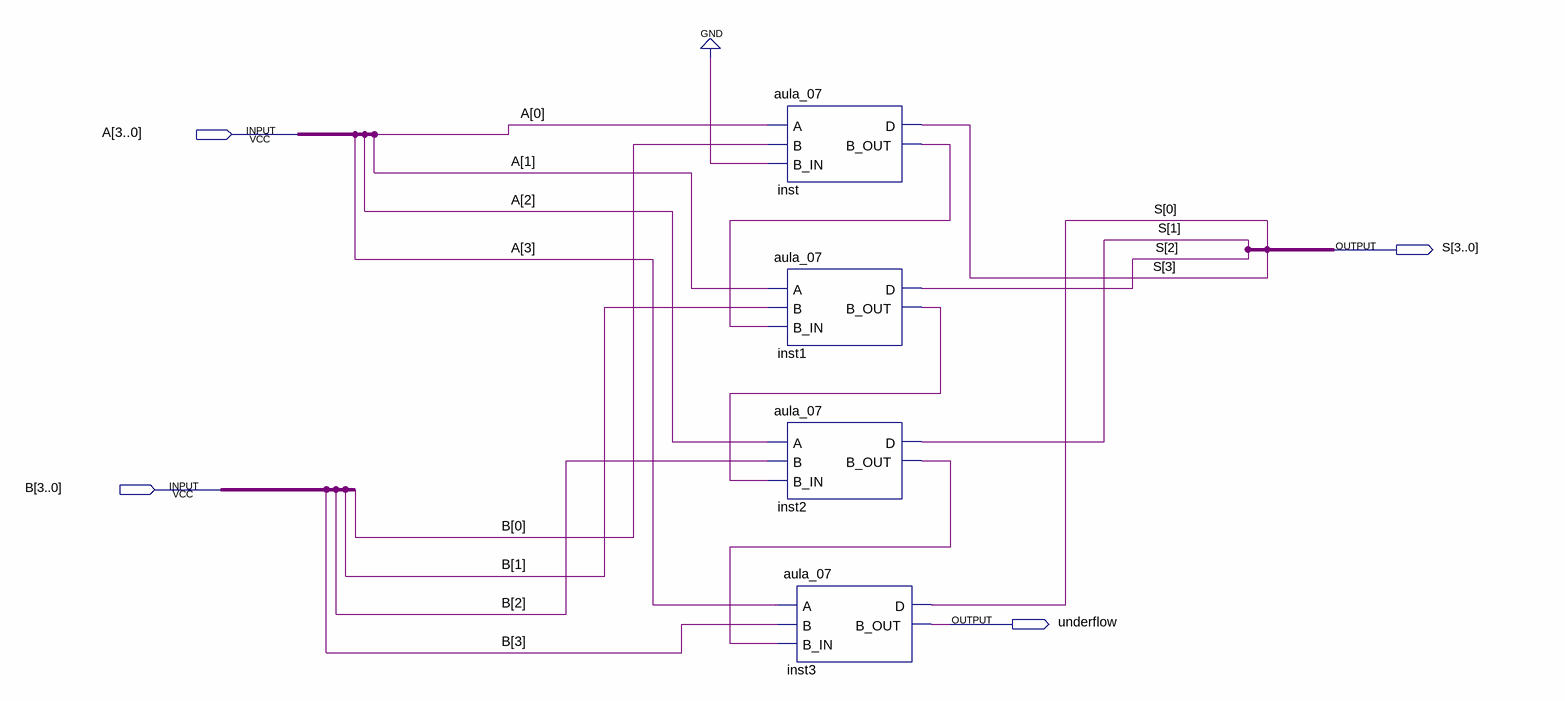
[diagram p0: schematic sheet]
// Quartus schematic aula_08.bdf as structural Verilog: 4 symbols, 4 pins
module aula_08 (
  input  [3:0] A,
  input  [3:0] B,
  output [3:0] S,
  output underflow
);

  wire inst1_b_out, inst2_b_out, inst_b_out;

  aula_07 inst (.A(A[0]), .B(B[0]), .B_IN(1'b0), .D(S[3]), .B_OUT(inst_b_out));
  aula_07 inst1 (.A(A[1]), .B(B[1]), .B_IN(inst_b_out), .D(S[2]), .B_OUT(inst1_b_out));
  aula_07 inst2 (.A(A[2]), .B(B[2]), .B_IN(inst1_b_out), .D(S[1]), .B_OUT(inst2_b_out));
  aula_07 inst3 (.A(A[3]), .B(B[3]), .B_IN(inst2_b_out), .D(S[0]), .B_OUT(underflow));
endmodule
